# Altium schematic sheet Display.SchDoc
size 406 x 304 mm; SheetNumber: 5; SheetTotal: 8
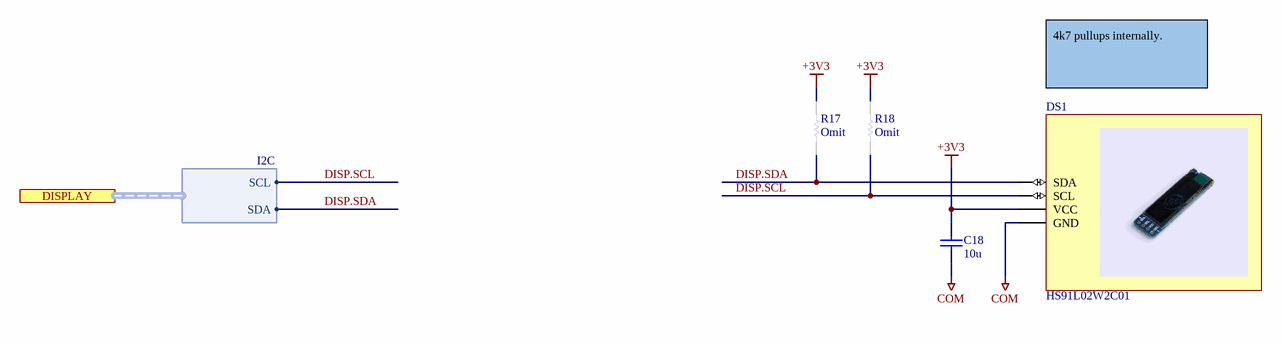
[diagram p0: Display.SchDoc]

## Parts
C18  10u  [CAPC1005X06N]
DS1  HS91L02W2C01  [HS_HS91L02W2C01]
R17  Omit  [RESC1005X04N]  (no BOM)
R18  Omit  [RESC1005X04N]  (no BOM)

## Ports
DISPLAY (harness I2C)

## Harnesses
I2C: SCL, SDA

## Nets
+3V3: C18.2 DS1.2(VCC) R17.2 R18.2
COM: C18.1 DS1.1(GND)
DISP.SCL: DS1.3(SCL) R18.1 ; port DISPLAY.SCL
DISP.SDA: DS1.4(SDA) R17.1 ; port DISPLAY.SDA

## Notes on the sheet
- 4k7 pullups internally.
- Sheet Name:
- Date:
- Sheet
- Designer:
- of

## Library data of the parts
C18 = CAP,Cer,10uF,10VDC,X5R,0402: 10 ï¿½F ï¿½20% 10V Ceramic Capacitor X5R 0402 (1005 Metric); Manufacturer 1: Samsung Electro-Mechanics; Manufacturer 1 Part Number: CL05A106MP5NUNC; Vendor 1 Part Number: 1276-1450-1-ND; Vendor 1: Digikey; Part Name: CAP,Cer,10uF,10VDC,X5R,0402; CreatedBy: Judd Foster; HelpURL: https://media.digikey.com/pdf/Data%20Sheets/Samsung%20PDFs/CL05A106MP5NUNC_Spec.pdf; Value: 10u
DS1 = DISP,Graphic,OLED,128x32,HS91L02W2C01: 0.91 128x32 SSD1306 chip I2C LCD, OLED, Graphic; Manufacturer 1: HS; Vendor 1 Part Number: C5248081; Vendor 1: LCSC; Part Name: DISP,Graphic,OLED,128x32,HS91L02W2C01; CreatedBy: Judd Foster; HelpURL: https://www.lcsc.com/datasheet/C5248081.pdf; Manufacturer 1 Part Number: HS91L02W2C01
R17 R18 = RES,Omit,0402: Part Name: RES,Omit,0402; CreatedBy: Judd Foster; HelpURL: N/A; Manufacturer 1: N/A; Manufacturer 1 Part Number: N/A; Vendor 1: N/A; Vendor 1 Part Number: N/A; Value: Omit